# Altium schematic sheet Controller_Section.SchDoc
size A4; DocumentNumber: 14; SheetNumber: 14; SheetTotal: 28
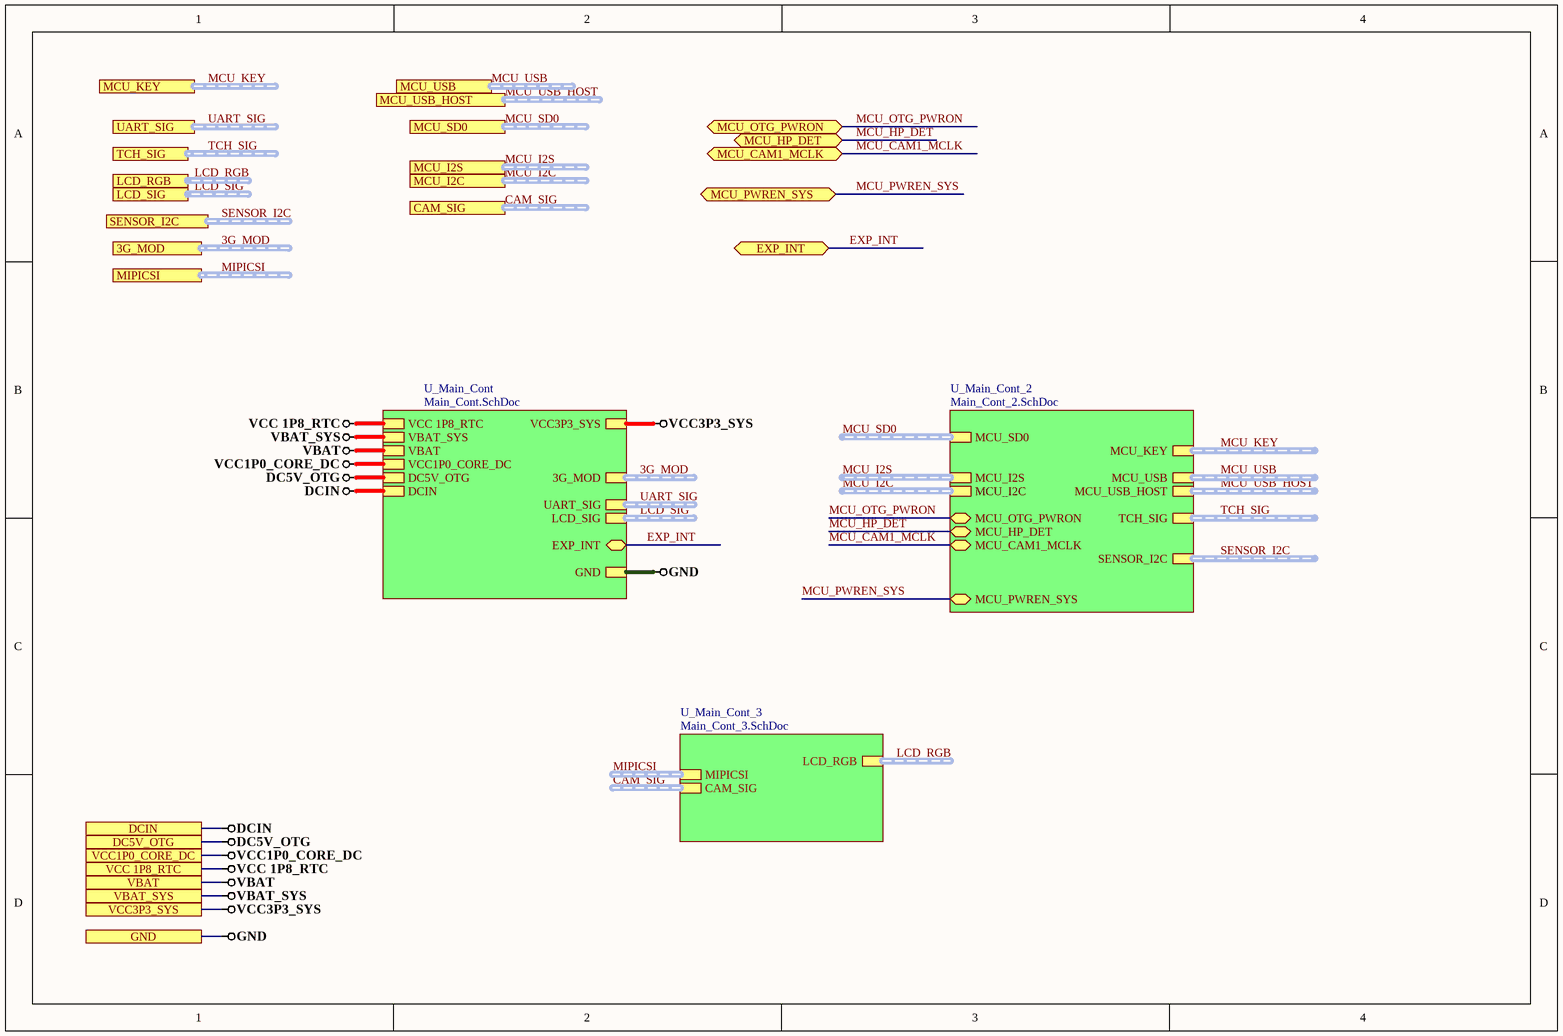
[diagram p0: Controller_Section.SchDoc]

## Sub-sheets
U_Main_Cont = Main_Cont.SchDoc: VCC 1P8_RTC, VBAT_SYS, VBAT, VCC1P0_CORE_DC, DC5V_OTG, DCIN, VCC3P3_SYS, GND, UART_SIG (harness UART_SIG), LCD_SIG (harness LCD_SIG), 3G_MOD (harness 3G_MOD), EXP_INT (bidir)
U_Main_Cont_2 = Main_Cont_2.SchDoc: MCU_SD0 (harness MCU_SD0), MCU_I2S (harness MCU_I2S), MCU_USB (harness MCU_USB), MCU_OTG_PWRON (bidir), MCU_I2C (harness MCU_I2C), MCU_KEY (harness MCU_KEY), MCU_HP_DET (bidir), MCU_CAM1_MCLK (bidir), MCU_USB_HOST (harness MCU_USB_HOST), TCH_SIG (harness TCH_SIG), MCU_PWREN_SYS (bidir), SENSOR_I2C (harness SENSOR_I2C)
U_Main_Cont_3 = Main_Cont_3.SchDoc: CAM_SIG (harness CAM_SIG), LCD_RGB (harness LCD_RGB), MIPICSI (harness MIPICSI)

## Ports
3G_MOD (harness 3G_MOD), CAM_SIG (harness CAM_SIG), DC5V_OTG, DCIN, EXP_INT (bidir), GND, LCD_RGB (harness LCD_RGB), LCD_SIG (harness LCD_SIG), MCU_CAM1_MCLK (bidir), MCU_HP_DET (bidir), MCU_I2C (harness MCU_I2C), MCU_I2S (harness MCU_I2S), MCU_KEY (harness MCU_KEY), MCU_OTG_PWRON (bidir), MCU_PWREN_SYS (bidir), MCU_SD0 (harness MCU_SD0), MCU_USB (harness MCU_USB), MCU_USB_HOST (harness MCU_USB_HOST), MIPICSI (harness MIPICSI), SENSOR_I2C (harness SENSOR_I2C), TCH_SIG (harness TCH_SIG), UART_SIG (harness UART_SIG), VBAT, VBAT_SYS, VCC1P0_CORE_DC, VCC3P3_SYS, VCC 1P8_RTC

## Nets
DC5V_OTG: port DC5V_OTG, sheet U_Main_Cont/DC5V_OTG
DCIN: port DCIN, sheet U_Main_Cont/DCIN
GND: port GND, sheet U_Main_Cont/GND
VBAT: port VBAT, sheet U_Main_Cont/VBAT
VBAT_SYS: port VBAT_SYS, sheet U_Main_Cont/VBAT_SYS
VCC1P0_CORE_DC: port VCC1P0_CORE_DC, sheet U_Main_Cont/VCC1P0_CORE_DC
VCC3P3_SYS: port VCC3P3_SYS, sheet U_Main_Cont/VCC3P3_SYS
VCC 1P8_RTC: port VCC 1P8_RTC, sheet U_Main_Cont/VCC 1P8_RTC
EXP_INT: port EXP_INT, sheet U_Main_Cont/EXP_INT
MCU_CAM1_MCLK: port MCU_CAM1_MCLK, sheet U_Main_Cont_2/MCU_CAM1_MCLK
MCU_HP_DET: port MCU_HP_DET, sheet U_Main_Cont_2/MCU_HP_DET
MCU_OTG_PWRON: port MCU_OTG_PWRON, sheet U_Main_Cont_2/MCU_OTG_PWRON
MCU_PWREN_SYS: port MCU_PWREN_SYS, sheet U_Main_Cont_2/MCU_PWREN_SYS

## Buses and harness runs
harness 3G_MOD = port 3G_MOD
harness 3G_MOD = sheet U_Main_Cont/3G_MOD
harness CAM_SIG = port CAM_SIG
harness CAM_SIG = sheet U_Main_Cont_3/CAM_SIG
harness LCD_RGB = port LCD_RGB
harness LCD_RGB = sheet U_Main_Cont_3/LCD_RGB
harness LCD_SIG = port LCD_SIG
harness LCD_SIG = sheet U_Main_Cont/LCD_SIG
harness MCU_I2C = port MCU_I2C
harness MCU_I2C = sheet U_Main_Cont_2/MCU_I2C
harness MCU_I2S = port MCU_I2S
harness MCU_I2S = sheet U_Main_Cont_2/MCU_I2S
harness MCU_KEY = port MCU_KEY
harness MCU_KEY = sheet U_Main_Cont_2/MCU_KEY
harness MCU_SD0 = port MCU_SD0
harness MCU_SD0 = sheet U_Main_Cont_2/MCU_SD0
harness MCU_USB = port MCU_USB
harness MCU_USB = sheet U_Main_Cont_2/MCU_USB
harness MCU_USB_HOST = port MCU_USB_HOST
harness MCU_USB_HOST = sheet U_Main_Cont_2/MCU_USB_HOST
harness MIPICSI = port MIPICSI
harness MIPICSI = sheet U_Main_Cont_3/MIPICSI
harness SENSOR_I2C = port SENSOR_I2C
harness SENSOR_I2C = sheet U_Main_Cont_2/SENSOR_I2C
harness TCH_SIG = port TCH_SIG
harness TCH_SIG = sheet U_Main_Cont_2/TCH_SIG
harness UART_SIG = port UART_SIG
harness UART_SIG = sheet U_Main_Cont/UART_SIG